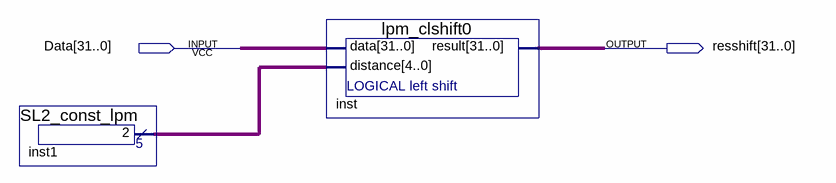
[diagram p0: schematic sheet]
// Quartus schematic ShiftLeft2.bdf as structural Verilog: 2 symbols, 2 pins
module ShiftLeft2 (
  input  [31:0] Data,
  output [31:0] resshift
);

  wire [4:0] inst1_result;

  SL2_const_lpm inst1 (.result(inst1_result));
  lpm_clshift0 inst (.data(Data), .distance(inst1_result), .result(resshift));
endmodule
